# Altium schematic sheet poyu.SchDoc
size A3; DocumentNumber: 1
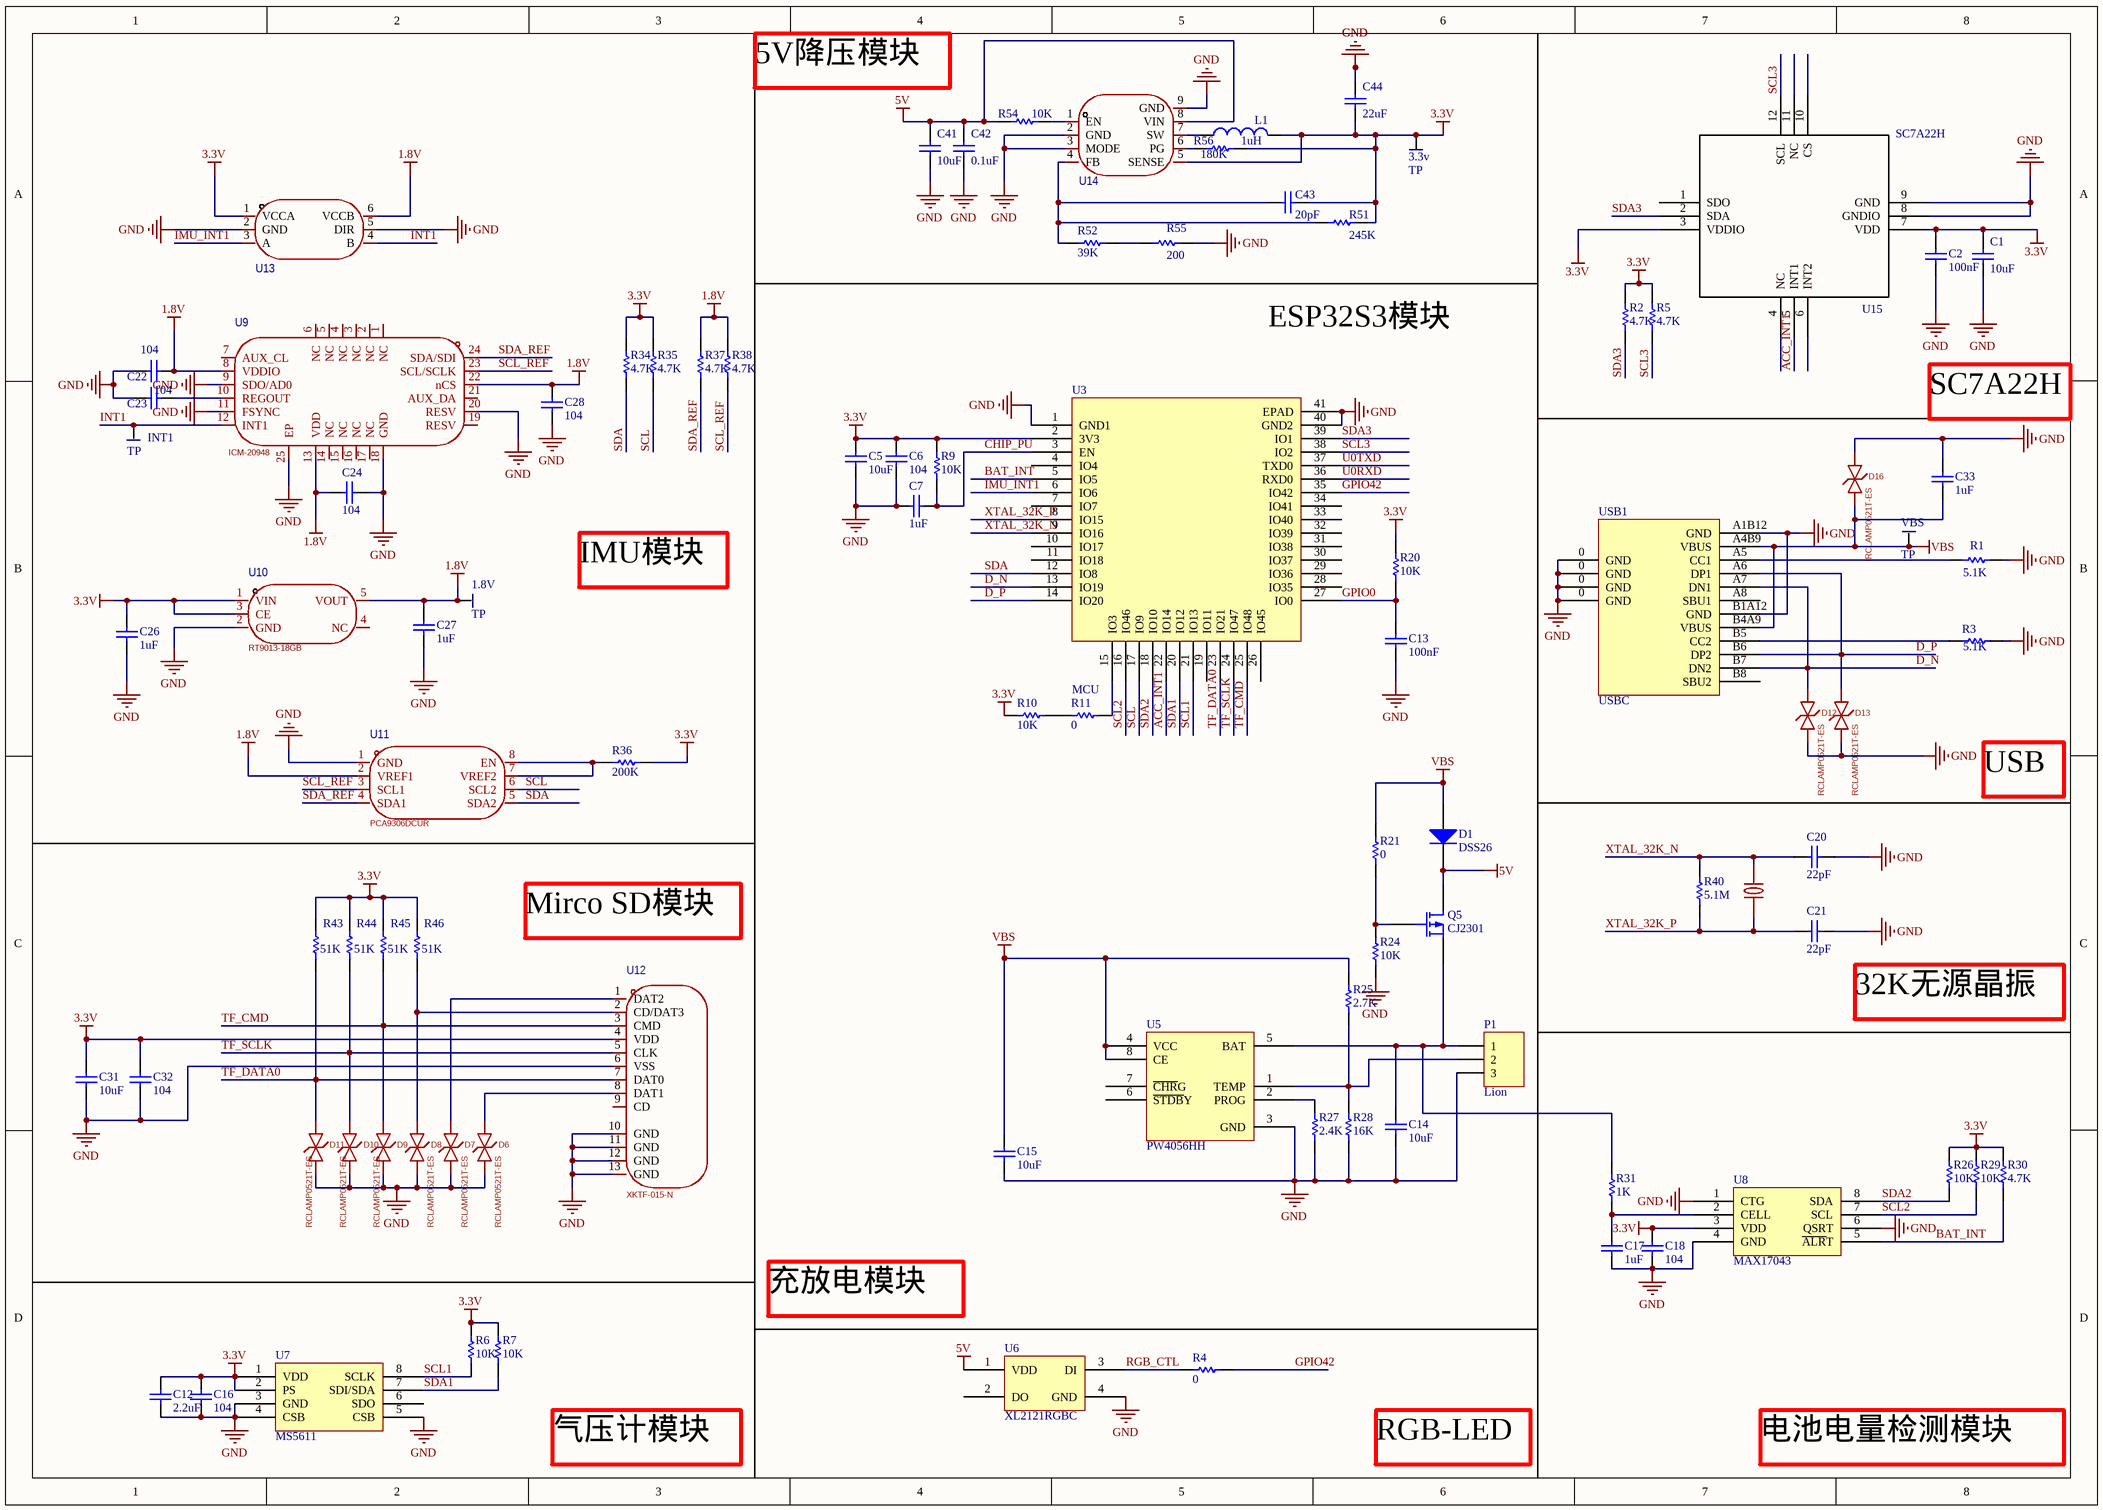
[diagram p0: poyu.SchDoc]

## Parts
1.8V  TP  [TP0.8]
3.3v  TP  [TP0.8]
C1  value 10uF  [C0805]  (hidden comment: Cap)
C2  value 100nF  [C0402]  (hidden comment: Cap)
C5  value 10uF  [C0805]  (hidden comment: Cap)
C6  value 104  [C0402]  (hidden comment: Cap)
C7  value 1uF  [C0402]  (hidden comment: Cap)
C12  value 2.2uF  [C0603]  (hidden comment: Cap)
C13  value 100nF  [C0402]  (hidden comment: Cap)
C14  value 10uF  [C0805]  (hidden comment: Cap)
C15  value 10uF  [C0805]  (hidden comment: Cap)
C16  value 104  [C0402]  (hidden comment: Cap)
C17  value 1uF  [C0603]  (hidden comment: Cap)
C18  value 104  [C0402]  (hidden comment: Cap)
C20  value 22pF  [C0402]  (hidden comment: Cap)
C21  value 22pF  [C0402]  (hidden comment: Cap)
C22  value 104  [C0402]  (hidden comment: Cap)
C23  value 104  [C0402]  (hidden comment: Cap)
C24  value 104  [C0402]  (hidden comment: Cap)
C26  value 1uF  [C0603]  (hidden comment: Cap)
C27  value 1uF  [C0603]  (hidden comment: Cap)
C28  value 104  [C0402]  (hidden comment: Cap)
C31  value 10uF  [C0805]  (hidden comment: Cap)
C32  value 104  [C0402]  (hidden comment: Cap)
C33  value 1uF  [C0805]  (hidden comment: Cap)
C41  value 10uF  [C0805]  (hidden comment: Cap)
C42  value 0.1uF  [C0402]  (hidden comment: Cap)
C43  value 20pF  [C0402]  (hidden comment: Cap)
C44  value 22uF  [C0805]  (hidden comment: Cap)
D1  DSS26  [425]
D6  RCLAMP0521T-ES  [DFN1006-2L-BI]
D7  RCLAMP0521T-ES  [DFN1006-2L-BI]
D8  RCLAMP0521T-ES  [DFN1006-2L-BI]
D9  RCLAMP0521T-ES  [DFN1006-2L-BI]
D10  RCLAMP0521T-ES  [DFN1006-2L-BI]
D11  RCLAMP0521T-ES  [DFN1006-2L-BI]
D12  RCLAMP0521T-ES  [DFN1006-2L-BI]
D13  RCLAMP0521T-ES  [DFN1006-2L-BI]
D16  RCLAMP0521T-ES  [DFN1006-2L-BI]
INT1  TP  [TP0.8]
L1  value 1uH  [IND-SMD_L6.0-W6.0_FNR60XXS]  (hidden comment: Inductor)
P1  Lion  [HDR1X3]
Q5  CJ2301  [SOT-23]
R1  5.1K  [C0402]
R2  value 4.7K  [C0402]  (hidden comment: 5.1K)
R3  5.1K  [C0402]
R4  value 0  [C0402]  (hidden comment: 5.1K)
R5  value 4.7K  [C0402]  (hidden comment: 5.1K)
R6  value 10K  [C0402]  (hidden comment: 5.1K)
R7  value 10K  [C0402]  (hidden comment: 5.1K)
R9  value 10K  [C0402]  (hidden comment: 5.1K)
R10  value 10K  [C0402]  (hidden comment: 5.1K)
R11  value 0  [C0402]  (hidden comment: 5.1K)
R20  10K  [C0402]
R21  value 0  [C0402]  (hidden comment: 5.1K)
R24  value 10K  [C0402]  (hidden comment: 5.1K)
R25  value 2.7K  [C0402]  (hidden comment: 5.1K)
R26  value 10K  [C0402]  (hidden comment: 5.1K)
R27  value 2.4K  [C0402]  (hidden comment: 5.1K)
R28  value 16K  [C0402]  (hidden comment: 5.1K)
R29  value 10K  [C0402]  (hidden comment: 5.1K)
R30  value 4.7K  [C0402]  (hidden comment: 5.1K)
R31  value 1K  [C0402]  (hidden comment: 5.1K)
R34  value 4.7K  [C0402]  (hidden comment: 5.1K)
R35  value 4.7K  [C0402]  (hidden comment: 5.1K)
R36  value 200K  [C0402]  (hidden comment: 5.1K)
R37  value 4.7K  [C0402]  (hidden comment: 5.1K)
R38  value 4.7K  [C0402]  (hidden comment: 5.1K)
R40  value 5.1M  [C0402]  (hidden comment: 5.1K)
R43  value 51K  [C0402]  (hidden comment: 5.1K)
R44  value 51K  [C0402]  (hidden comment: 5.1K)
R45  value 51K  [C0402]  (hidden comment: 5.1K)
R46  value 51K  [C0402]  (hidden comment: 5.1K)
R51  value 245K  [C0402]  (hidden comment: Res1)
R52  value 39K  [C0402]  (hidden comment: Res1)
R54  value 10K  [C0402]  (hidden comment: Res1)
R55  value 200  [C0402]  (hidden comment: Res1)
R56  value 180K  [C0402]  (hidden comment: Res1)
U3  MCU  [WIRELM-SMD_ESP32-S3-WROOM-1]
U5  PW4056HH  [SOP8_L]
U6  XL2121RGBC  [SMD-4P]
U7  MS5611  [SOP8_5611]
U8  MAX17043  [MAX17043]
U9  ICM-20948  [QFN40P300X300X105-24N]
U10  RT9013-18GB  [SOT-23-5_L3.0-W1.7-P0.95-LS2.8-BR]
U11  PCA9306DCUR  [SSOP-8_L2.0-W2.3-P0.50-LS3.1-BR]
U12  XKTF-015-N  [TF-SMD_XKTF-015-N]
U13  SN74AVC1T45DBVR  [SOT-23-6_L2.9-W1.6-P0.95-LS2.8-BR]  (value not drawn)
U14  SGM61022XTDE8G/TR  [DFN-8_L2.0-W2.0-P0.50-BL-EP]  (value not drawn)
U15  SC7A22H  [LGA-12_L2.0-W2.0-P0.50-BL]
USB1  USBC  [USB-C-SMD_TYPE-C-USB-5]
VBS  TP  [TP0.8]
X1  32.768kHz  [OSC-SMD_L3.2-W1.5]  (value not drawn)

## Nets
1.8V: 1.8V.TP C22.2 C24.2 C27.1 C28.1 R37.1 R38.1 U9.8(VDDIO) U9.13(VDD) U9.22(nCS) U10.5(VOUT) U11.2(VREF1) U13.6(VCCB)
3.3V: 3.3v.TP C1.2 C2.2 C5.1 C6.1 C12.2 C16.2 C18.2 C26.1 C31.2 C32.2 C43.1 C44.1 L1.2 R2.1 R5.1 R6.2 R7.2 R9.2 R10.2 R20.1 R26.2 R29.2 R30.2 R34.1 R35.1 R36.2 R43.1 R44.1 R45.1 R46.1 R51.1 R56.1 U3.2(3V3) U7.1(VDD) U7.2(PS) U8.3(VDD) U10.1(VIN) U10.3(CE) U12.4(VDD) U13.1(VCCA) U14.5(SENSE) U15.3(VDDIO) U15.7(VDD)
5V: C41.2 C42.2 D1.1(K) Q5.3(D) R54.2 U6.1(VDD) U14.8(VIN)
GND: C1.1 C2.1 C5.2 C6.2 C7.2 C12.1 C13.1 C14.1 C15.1 C16.1 C17.1 C18.1 C20.1 C21.1 C22.1 C23.1 C24.1 C26.2 C27.2 C28.2 C31.1 C32.1 C33.2 C41.1 C42.1 C44.2 D6.1 D7.1 D8.1 D9.1 D10.1 D11.1 D12.1 D13.1 D16.2 P1.3 R1.2 R3.1 R24.2 R27.2 R28.1 R55.2 U3.1(GND1) U3.40(GND2) U3.41(EPAD) U5.3(GND) U6.4(GND) U7.3(GND) U7.4(CSB) U7.5(CSB) U8.1(CTG) U8.4(GND) U8.6(QSRT) U9.9(SDO/AD0) U9.11(FSYNC) U9.18(GND) U9.20(RESV) U9.25(EP) U10.2(GND) U11.1(GND) U12.6(VSS) U12.10(GND) U12.11(GND) U12.12(GND) U12.13(GND) U13.2(GND) U13.5(DIR) U14.2(GND) U14.3(MODE) U14.9(GND) U15.8(GNDIO) U15.9(GND) USB1.0(GND) USB1.A1B12(GND) USB1.B1A12(GND)
VBS: C15.2 C33.1 D1.2(A) D16.1 R21.1 R25.2 U5.4(VCC) U5.8(CE) USB1.A4B9(VBUS) USB1.B4A9(VBUS) VBS.TP
ACC_INT1: U3.22(IO14) U15.5(INT1)
BAT_INT: R30.1 U3.5(IO5) U8.5(~{ALR}T)
CHIP_PU: C7.1 R9.1 U3.3(EN)
D_N: D12.2 U3.13(IO19) USB1.A7(DN1) USB1.B7(DN2)
D_P: D13.2 U3.14(IO20) USB1.A6(DP1) USB1.B6(DP2)
GPIO0: C13.2 R20.2 U3.27(IO0)
GPIO42: R4.1 U3.35(IO42)
IMU_INT1: U3.6(IO6) U13.3(A)
INT1: INT1.TP U9.12(INT1) U13.4(B)
RGB_CTL: R4.2 U6.3(DI)
SCL: R35.2 U3.17(IO9) U11.6(SCL2)
SCL1: R6.1 U3.21(IO13) U7.8(SCLK)
SCL2: R29.1 U3.16(IO46) U8.7(SCL)
SCL3: R5.2 U3.38(IO2) U15.12(SCL)
SCL_REF: R38.2 U9.23(SCL/SCLK) U11.3(SCL1)
SDA: R34.2 U3.12(IO8) U11.5(SDA2)
SDA1: R7.1 U3.20(IO12) U7.7(SDI/SDA)
SDA2: R26.1 U3.18(IO10) U8.8(SDA)
SDA3: R2.2 U3.39(IO1) U15.2(SDA)
SDA_REF: R37.2 U9.24(SDA/SDI) U11.4(SDA1)
TF_CMD: D9.2 R45.2 U3.25(IO48) U12.3(CMD)
TF_DATA0: D11.2 R43.2 U3.23(IO21) U12.7(DAT0)
TF_SCLK: D10.2 R44.2 U3.24(IO47) U12.5(CLK)
U0RXD: U3.36(RXD0)
U0TXD: U3.37(TXD0)
XTAL_32K_N: C20.2 R40.1 U3.9(IO16) X1.2
XTAL_32K_P: C21.2 R40.2 U3.8(IO15) X1.1
NetC14_2: C14.2 P1.1 Q5.2(S) R31.1 U5.5(BAT)
NetC17_2: C17.2 R31.2 U8.2(CELL)
NetC23_2: C23.2 U9.10(REGOUT)
NetC43_2: C43.2 R51.2 R52.2 U14.4(FB)
NetD6_2: D6.2 U12.8(DAT1)
NetD7_2: D7.2 U12.1(DAT2)
NetD8_2: D8.2 R46.2 U12.2(CD/DAT3)
NetL1_1: L1.1 U14.7(SW)
NetP1_2: P1.2 R25.1 R28.2 U5.1(TEMP)
NetQ5_1: Q5.1(G) R21.2 R24.1
NetR1_1: R1.1 USB1.A5(CC1)
NetR3_2: R3.2 USB1.B5(CC2)
NetR10_1: R10.1 R11.1
NetR11_2: R11.2 U3.15(IO3)
NetR27_1: R27.1 U5.2(PROG)
NetR36_1: R36.1 U11.7(VREF2) U11.8(EN)
NetR52_1: R52.1 R55.1
NetR54_1: R54.1 U14.1(EN)
NetR56_2: R56.2 U14.6(PG)

Not connected (* = marked no-connect by the designer): U3 4(IO4) 7(IO7) 10(IO17) 11(IO18) 19(IO11) 26(IO45) 28(IO35) 29(IO36) 30(IO37) 31(IO38) 32(IO39) 33(IO40) 34(IO41); U5 6(~{STDB}Y) 7(~{CHR}G); U6 2(DO); U7 6(SDO); U9 1(NC) 2(NC) 3(NC) 4(NC) 5(NC) 6(NC) 7(AUX_CL) 14(NC) 15(NC) 16(NC) 17(NC) 19(RESV) 21(AUX_DA); U10 4(NC); U12 9(CD); U15 1(SDO) 4(NC) 6(INT2) 10(CS) 11(NC); USB1 A8(SBU1) B8(SBU2)

## Notes on the sheet
- 5V降压模块
- ESP32S3模块
- SC7A22H
- IMU模块
- USB
- Mirco SD模块
- (near C21) 32K无源晶振
- 充放电模块
- 气压计模块
- RGB-LED
- 电池电量检测模块

## Library data of the parts
C1 C2 C5-C7 C12-C18 C20-C24 C26-C28 C31-C33 C41-C44 = Cap: Capacitor; Published: 8-Jun-2000; LatestRevisionDate: 17-Jul-2002; LatestRevisionNote: Re-released for DXP Platform.; PackageReference: RAD-0.3; Publisher: Altium Limited
  C1 C41-C44: PackageDescription: Radial Cap, Thru-Hole; 2 Leads; 0.3 in Pin Spacing
D1 = Diode: Default Diode; Published: 8-Jun-2000; LatestRevisionDate: 17-Jul-2002; LatestRevisionNote: Re-released for DXP Platform.; PackageDocument: Sep-1996; PackageReference: SMC; Publisher: Altium Limited; Code_JEDEC: DO-214-AB
D6-D13 D16 = RCLAMP0521T-ES: Manufacturer: ElecSuper(静芯微); Add into BOM: yes; polarity: 双向; Reverse Stand-Off Voltage (Vrwm): 5V; Maximum Clamping Voltage: 18V; Peak Pulse Current (Ipp): 4A; Peak Pulse Power Dissipation (Ppp): 80W; Breakdown Voltage: 6V; Reverse Leakage Current (Ir): 1uA; Number of Lines: 单路; Type: ESD; Symbol: RCLAMP0521T-ES; Device: RCLAMP0521T-ES; LCSC Part Name: 0521/0531，单路双向ESD静电防护器件，20kV，CJ：0.25pF；HDMI/USB/NFC/RF超高速接口通讯防护; Supplier Part: C5180263; Manufacturer Part: RCLAMP0521T-ES; Supplier Footprint: DFN1006-2L; JLCPCB Part Class: Extended Part; Datasheet: https://atta.szlcsc.com/upload/public/pdf/source/20240905/E90AFA5EC59D44930BEC0D45A1143918.pdf; Supplier: LCSC; Convert to PCB: yes; Operating Temperature: -
L1 = Inductor: Code_IEC: 1005; Published: 8-Jun-2000; LatestRevisionDate: 29-May-2009; LatestRevisionNote: IPC-7351 Footprint Added.; PackageReference: 0402-A; Publisher: Altium Limited; PackageDescription: Chip Inductor; Code_JEITA: 0402
P1 = Header 3: Header, 3-Pin; LatestRevisionDate: 17-Jul-2002; LatestRevisionNote: Re-released for DXP Platform.; Publisher: Altium Limited
Q5 = MOSFET-P: P-Channel MOSFET; PackageDocument: 1995/1996; Published: 8-Jun-2000; LatestRevisionDate: 17-Jul-2002; LatestRevisionNote: Re-released for DXP Platform.; PackageReference: E3; Publisher: Altium Limited
R1-R7 R9-R11 R20 R21 R24-R31 R34-R38 R40 R43-R46 R51 R52 R54-R56 = Res1: Resistor; Published: 8-Jun-2000; LatestRevisionDate: 17-Jul-2002; LatestRevisionNote: Re-released for DXP Platform.; PackageReference: AXIAL-0.3; Publisher: Altium Limited
  R1 R3: Value: 5.1K
  R20: Value: 10K
  R51 R52 R54-R56: PackageDescription: Axial Device, Thru-Hole; 2 Leads; 0.3 in Pin Spacing
U3 = ESP32-S3
U5 = TP4056
U9 = ICM-20948: Add into BOM: yes; Symbol: ICM-20948; Device: ICM-20948; LCSC Part Name: ICM-20948; Supplier Part: C726001; Manufacturer Part: ICM-20948; Supplier Footprint: QFN-24(3x3); JLCPCB Part Class: Extended Part; Datasheet: https://atta.szlcsc.com/upload/public/pdf/source/20210715/C726001_EFE09342631EBC06FA98BEAE6CEEEE9D.pdf; Supplier: LCSC; Convert to PCB: yes
U10 = RT9013-18GB_C22435116: Add into BOM: yes; Voltage - Supply: 7V; Output Voltage: 1.8V; Output Current: 500mA; Power Supply Rejection Ratio (PSRR): 75dB@(1kHz); Number of Outputs: 1; Symbol: RT9013-18GB_C22435116; Device: RT9013-18GB_C22435116; LCSC Part Name: RT9013-18GB; Supplier Part: C22435116; Manufacturer Part: RT9013-18GB; Supplier Footprint: SOT-23-5; JLCPCB Part Class: Extended Part; Datasheet: https://atta.szlcsc.com/upload/public/pdf/source/20240521/96856EEC3938E9CD57929E5A61E5793B.pdf; Supplier: LCSC; Convert to PCB: yes
U11 = PCA9306DCUR: Add into BOM: yes; Voltage - Supply(VCCA): 1.2V~3.3V; Voltage - Supply(VCCB): 1.8V~5.5V; Number of Circuits: 2; Symbol: PCA9306DCUR; Device: PCA9306DCUR; Supplier Part: C33196; Manufacturer Part: PCA9306DCUR; Supplier Footprint: VSSOP-8; JLCPCB Part Class: Extended Part; Datasheet: https://www.ti.com/cn/lit/gpn/pca9306; Supplier: LCSC; Convert to PCB: yes; Input Signal: -; Output Signal: -; Data Rate: -
U12 = XKTF-015-N: Manufacturer: XKB Connection(中国星坤); Add into BOM: yes; Card Connection Mode: 自弹式; Card Type: MicroSD卡(TF卡); Connector Type: 卡座; Maximum Body Height: 2mm; Symbol: XKTF-015-N; Device: XKTF-015-N; LCSC Part Name: 自弹式 MicroSD卡(TF卡) 卡座; Supplier Part: C381082; Manufacturer Part: XKTF-015-N; Supplier Footprint: SMD; JLCPCB Part Class: Extended Part; Datasheet: https://atta.szlcsc.com/upload/public/pdf/source/20211011/66E84C7106D817B4016DBCE6B64BEDA0.pdf; Supplier: LCSC; Convert to PCB: yes; Additional Card Detection Pins: -; Supplementary Features: -; Operating Temperature Range: -25℃~+90℃
U13 = SN74AVC1T45DBVR: Manufacturer: TI(德州仪器); Add into BOM: yes; Channel Type: 双向; Data Rate: 500Mbps; Voltage - Supply(VCCA): 1.2V~3.6V; Number of Circuits: 1; Output Type: 三态; Symbol: SN74AVC1T45DBVR; Device: SN74AVC1T45DBVR; LCSC Part Name: SN74AVC1T45DBVR; Supplier Part: C131978; Manufacturer Part: SN74AVC1T45DBVR; Supplier Footprint: SOT-23-6; JLCPCB Part Class: Extended Part; Datasheet: https://www.ti.com/cn/lit/gpn/sn74avc1t45; Supplier: LCSC; Convert to PCB: yes; Voltage - Supply(VCCB): 1.2V~3.6V; Operating Temperature: -40℃~+85℃
U14 = SGM61022XTDE8G/TR: Manufacturer: SGMICRO(圣邦微); Add into BOM: yes; Function: 降压型; Synchronous Rectifier: 是; Symbol: SGM61022XTDE8G/TR; Device: SGM61022XTDE8G/TR; LCSC Part Name: SGM61022XTDE8G/TR; Supplier Part: C5153652; Manufacturer Part: SGM61022XTDE8G/TR; Supplier Footprint: TDFN-8AL(2x2); JLCPCB Part Class: Extended Part; Datasheet: https://atta.szlcsc.com/upload/public/pdf/source/20230209/306941469271C3C65293AD562616D747.pdf; Supplier: LCSC; Convert to PCB: yes
USB1 = USB_TYPEC
X1 = X321532768KGD2SI: Add into BOM: yes; Load Capacitance: 12.5pF; Symbol: X321532768KGD2SI; Device: X321532768KGD2SI; Supplier Part: C620155; Manufacturer Part: X321532768KGD2SI; Supplier Footprint: SMD3215-2P; JLCPCB Part Class: Extended Part; Datasheet: https://atta.szlcsc.com/upload/public/pdf/source/20240329/3A7650FD985DD0DE85694D3785AB4916.pdf; Supplier: LCSC; Convert to PCB: yes; Value: 32.768kHz